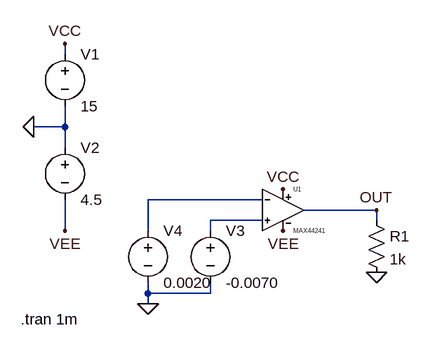
[diagram p0: schematic max44241_dcload_problem.asc]
max44241_dcload_problem.asc, the LTspice schematic file:
Version 4
SHEET 1 880 680
WIRE -112 -96 -112 -112
WIRE -112 16 -112 -16
WIRE -112 16 -160 16
WIRE -112 48 -112 16
WIRE 192 128 16 128
WIRE 368 144 256 144
WIRE 192 160 112 160
WIRE 368 160 368 144
WIRE -112 176 -112 128
WIRE 16 176 16 128
WIRE 112 176 112 160
WIRE 16 272 16 256
WIRE 112 272 112 256
WIRE 112 272 16 272
WIRE 16 288 16 272
FLAG -160 16 0
FLAG -112 -112 VCC
FLAG -112 176 VEE
FLAG 224 112 VCC
FLAG 224 176 VEE
FLAG 16 288 0
FLAG 368 240 0
FLAG 368 144 OUT
SYMBOL MAX44241 224 80 R0
SYMATTR InstName U1
SYMBOL voltage -112 -112 R0
WINDOW 123 0 0 Left 0
WINDOW 39 0 0 Left 0
SYMATTR InstName V1
SYMATTR Value 15
SYMBOL voltage -112 32 R0
WINDOW 123 0 0 Left 0
WINDOW 39 0 0 Left 0
SYMATTR InstName V2
SYMATTR Value 4.5
SYMBOL voltage 112 160 R0
WINDOW 123 0 0 Left 0
WINDOW 39 0 0 Left 0
SYMATTR InstName V3
SYMATTR Value -0.0070
SYMBOL voltage 16 160 R0
WINDOW 123 0 0 Left 0
WINDOW 39 0 0 Left 0
SYMATTR InstName V4
SYMATTR Value 0.0020
SYMBOL res 352 144 R0
SYMATTR InstName R1
SYMATTR Value 1k
TEXT -180 312 Left 2 !.tran 1m

The netlist it stands for:
* max44241_dcload_problem.asc
XU1 N002 N001 VCC VEE OUT MAX44241  ; pins INA+ INA- VDD VSS OUTA
V1 VCC 0 15
V2 0 VEE 4.5
V3 N002 0 -0.0070
V4 N001 0 0.0020
R1 OUT 0 1k
.tran 1m
.lib MAX44241.lib
.backanno
.end